# EAGLE design cdio_rx (EAGLE 9.6.2)
CDIO - PCB del auto (RX). Generado por pcb_rx/generar_pcb.py
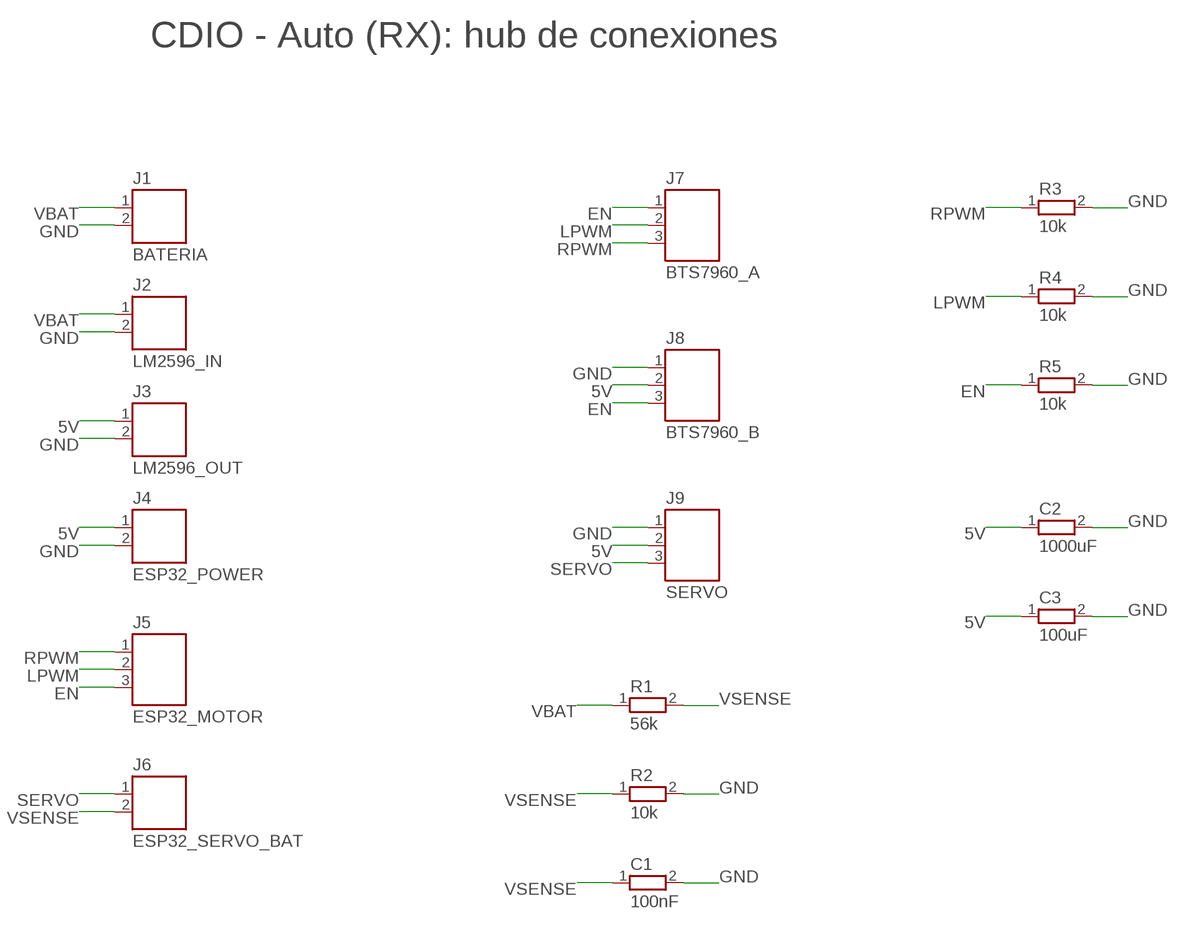
[diagram p0: schematic, sheet 1]

## Parts
C1  100nF  C5  [C-5]
C2  1000uF  CP10  [CPOL-5-D10]
C3  100uF  CP8  [CPOL-5-D8]
J1  BATERIA  TB2  [KF301-2]
J2  LM2596_IN  TB2  [KF301-2]
J3  LM2596_OUT  TB2  [KF301-2]
J4  ESP32_POWER  TB2  [KF301-2]
J5  ESP32_MOTOR  TB3  [KF301-3]
J6  ESP32_SERVO_BAT  TB2  [KF301-2]
J7  BTS7960_A  TB3  [KF301-3]
J8  BTS7960_B  TB3  [KF301-3]
J9  SERVO  [HDR1X3]
R1  56k  R15  [R-0207/15]
R2  10k  R5  [R-0207/5V]
R3  10k  R15  [R-0207/15]
R4  10k  R10  [R-0207/10]
R5  10k  R5  [R-0207/5V]

## Nets
5V: C2.1(+) C3.1(+) J3.1 J4.1 J8.2 J9.2
EN: J5.3 J7.1 J8.3 R5.1
GND: C1.2 C2.2(-) C3.2(-) J1.2 J2.2 J3.2 J4.2 J8.1 J9.1 R2.2 R3.2 R4.2 R5.2
LPWM: J5.2 J7.2 R4.1
RPWM: J5.1 J7.3 R3.1
SERVO: J6.1 J9.3
VBAT: J1.1 J2.1 R1.1
VSENSE: C1.1 J6.2 R1.2 R2.1

## Notes on the sheet
- CDIO - Auto (RX): hub de conexiones

## Library data of the parts
C1 = cdio:C5
C2 = cdio:CP10
C3 = cdio:CP8
J1-J4 J6 = cdio:TB2
J5 J7 J8 = cdio:TB3
J9 = cdio:SERVO
R1 R3 = cdio:R15
R2 R5 = cdio:R5
R4 = cdio:R10

## Board
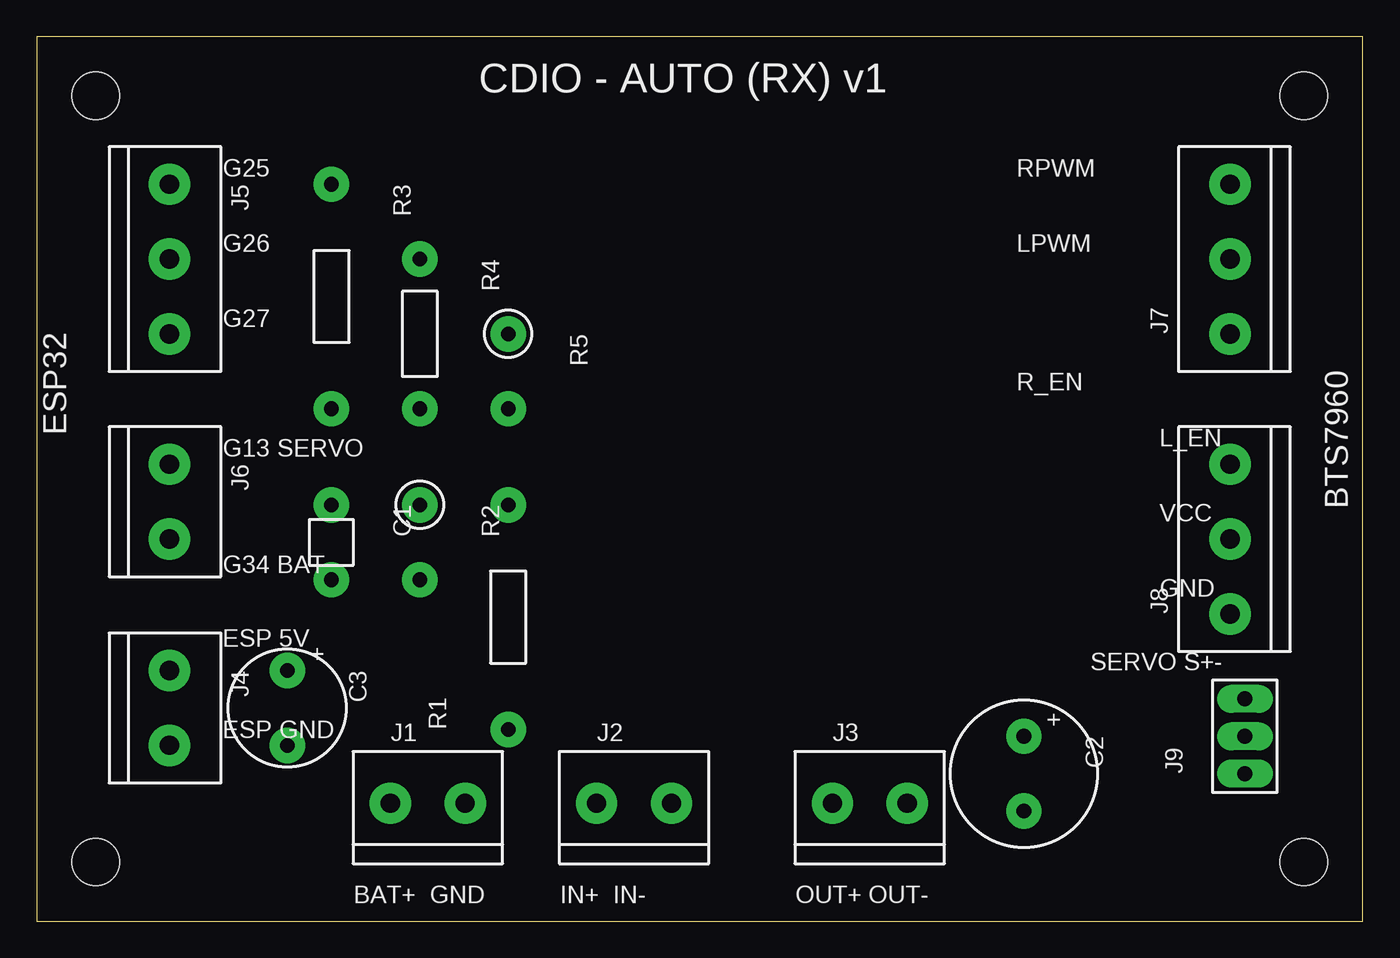
[diagram p1: board, top side]
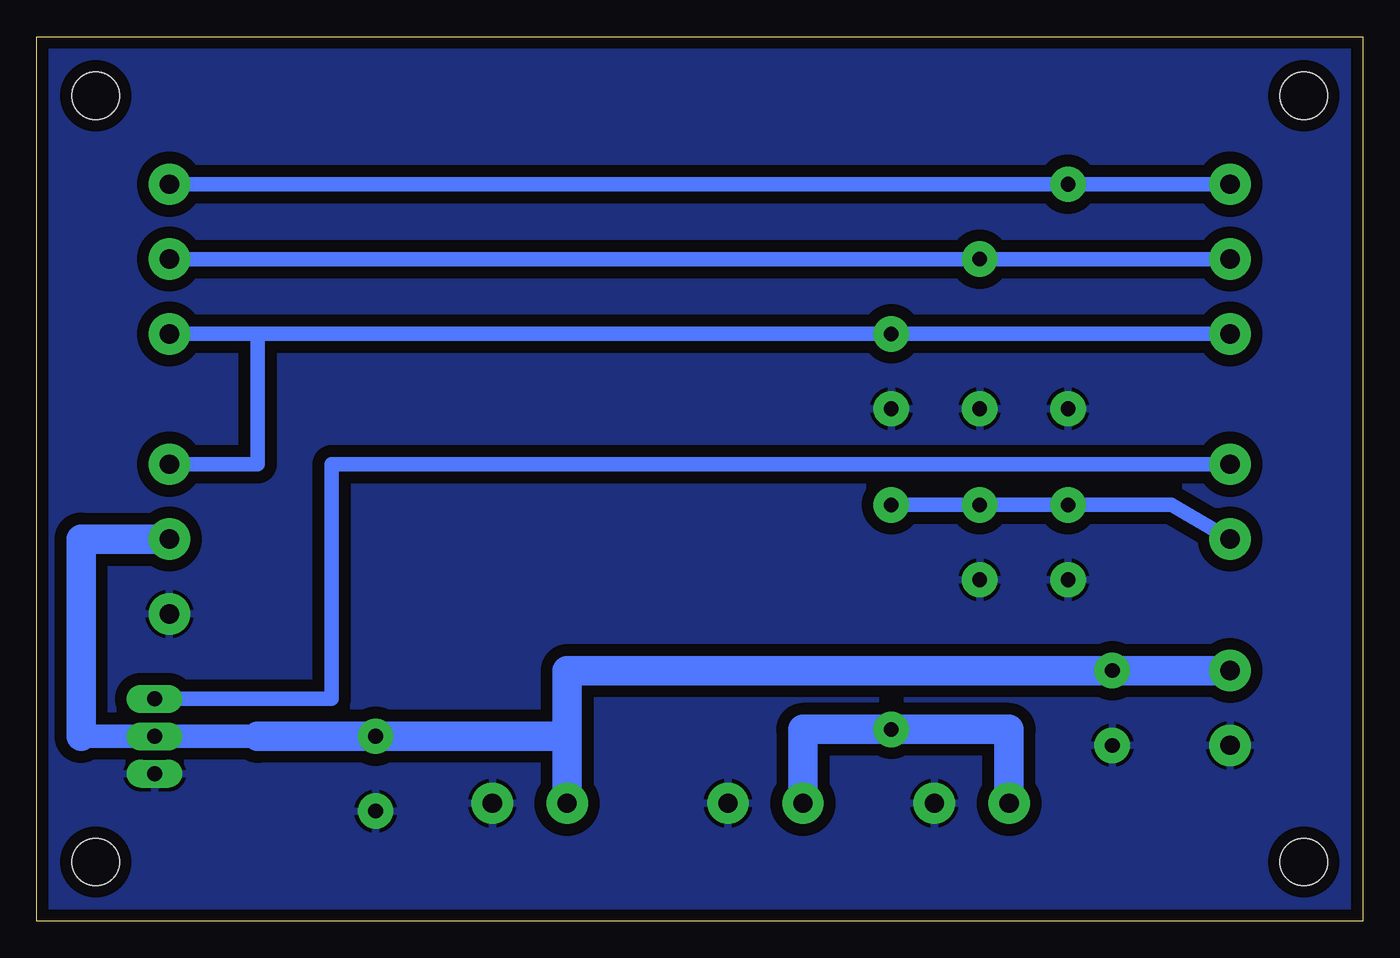
[diagram p2: board, bottom side, seen from below]

Size 90 x 60 mm. Coordinates in mm from the lower left corner, seen from the top.
Outline: 0,0 90,0 90,60 0,60 0,0
Copper layers (1*16): Top 0.035mm / dielectric 1.5mm / Bottom
Design rules "cdio_cnc": minimum track width 0.8mm, minimum drill 0.8mm, track to track 0.6mm, track to pad 0.6mm, pad to pad 0.6mm, via to via 0.6mm, smd to smd 0.6mm, copper to edge 0.5mm, drill to drill 0.4mm, minimum pad ring 0.4mm
Holes 3.2 mm at 4,4 86,4 4,56 86,56

### Footprints (pad centres in the part's own frame; a part is rotated, then mirrored left to right if it is on the bottom)
C-5 = drill 1 pad 2.4 round: 1 0,0; 2 5.08,0
CPOL-5-D10 = drill 1 pad 2.4 round: 1 0,0; 2 5.08,0
CPOL-5-D8 = drill 1 pad 2.4 round: 1 0,0; 2 5.08,0
KF301-2 = drill 1.3 pad 2.8 round: 1 0,0; 2 5.08,0
KF301-3 = drill 1.3 pad 2.8 round: 1 0,0; 2 5.08,0; 3 10.16,0
HDR1X3 = drill 1 pad 1.9 long: 1 0,0; 2 2.54,0; 3 5.08,0
R-0207/15 = drill 1 pad 2.4 round: 1 0,0; 2 15.24,0
R-0207/5V = drill 1 pad 2.4 round: 1 0,0; 2 5.08,0
R-0207/10 = drill 1 pad 2.4 round: 1 0,0; 2 10.16,0

### Placement (x,y rotation side)
C1  20,28.24 270 top
C2  67,12.54 270 top
C3  17,17 270 top
J1  24,8 0 top
J2  38,8 0 top
J3  54,8 0 top
J4  9,17 270 top
J5  9,50 270 top
J6  9,31 270 top
J7  81,39.84 90 top
J8  81,20.84 90 top
J9  82,10 90 top
R1  32,13 90 top
R2  26,28.24 270 top
R3  20,50 270 top
R4  26,44.92 270 top
R5  32,39.84 270 top

### Tracks (layer width: path | path; a pad name or v marks a point on that pad's centre or on a via)
5V
  Bottom 1.6: 75,12.54 J9.2 87,12.54
  Bottom 2: J4.1 C3.1 54,17 54,12.54 | 54,12.54 J3.1 | 54,12.54 C2.1 75,12.54 | 87,12.54 87,25.92 J8.2
EN
  Bottom 1: J5.3 R5.1 75,39.84 | 75,39.84 J7.1 | 75,39.84 75,31 J8.3
GND
  pour Bottom (isolate 0.8): 0.6,0.6 89.4,0.6 89.4,59.4 0.6,59.4
LPWM
  Bottom 1: J5.2 R4.1 J7.2
RPWM
  Bottom 1: J5.1 R3.1 J7.3
SERVO
  Bottom 1: J6.1 70,31 70,15.08 J9.3
VBAT
  Bottom 2: J1.1 24,13 R1.1 38,13 J2.1
VSENSE
  Bottom 1: R1.2 R2.1 C1.1 13,28.24 J6.2

### Text on the board
tPlace: CDIO - AUTO (RX) v1 | G25 | RPWM | G26 | LPWM | G27 | R_EN | ESP32 | G13 SERVO | L_EN | BTS7960 | VCC | G34 BAT | GND | ESP 5V | SERVO S+- | ESP GND | BAT+ GND | IN+ IN- | OUT+ OUT-